# Altium schematic sheet 1_Power.schdoc
size 297 x 209 mm; Symbol: Drawing-Symbol_A4; Device: Drawing-Symbol_A4; @Project Name: Irrigation Controller v2; @Page Count: 5; @Update Date: 2026-11-21; @Create Date: 2026-11-21; @Schematic Name: Schematic1; @Page No: 1; @Page Name: 1_Power; Company: EasyEDA.com; Version: V1.0; Page Size: A4; @Create Time: 17:26:39; @Update Time: 17:26:39; Border: 1; Width: 1170; Height: 825; Region Start: 1; X Region Count: 6; Y Region Count: 4; Blade Width: 10; Title Block Position: 3; @Board Name: Board1
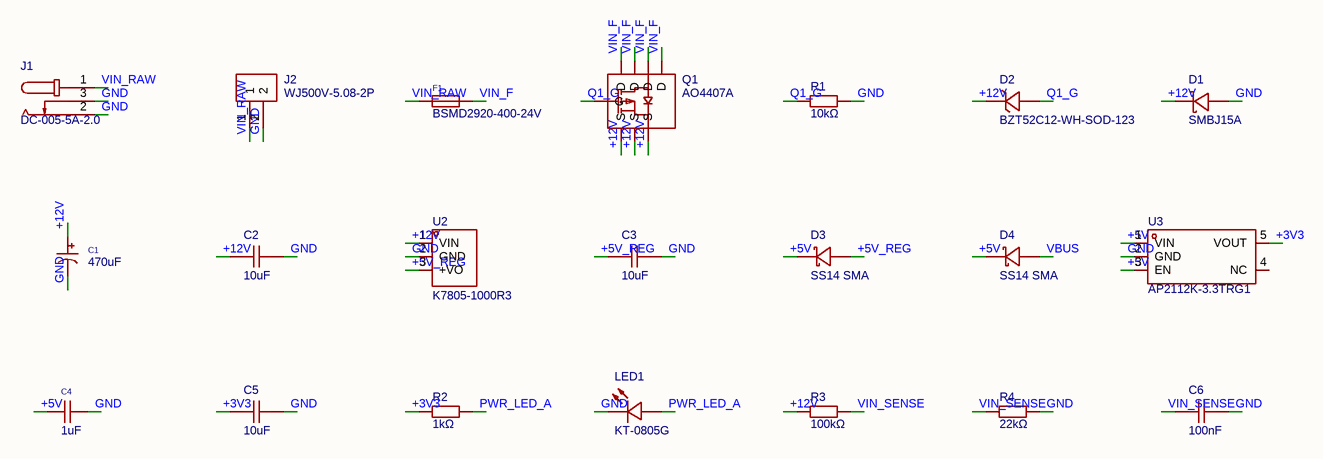
[diagram p0: 1_Power.schdoc]

## Parts
C1  470uF  [CAP-SMD_BD10.0-L10.3-W10.3-LS11.0-FD]
C2  10uF  [C0805]
C3  10uF  [C0805]
C4  1uF  [C0805]
C5  10uF  [C0805]
C6  100nF  [C0805]
D1  SMBJ15A  [SMB_L4.6-W3.6-LS5.3-RD]
D2  BZT52C12-WH-SOD-123  [SOD-123_L2.7-W1.7-LS3.8-RD]
D3  SS14 SMA  [SMA_L4.3-W2.6-LS5.1-RD]
D4  SS14 SMA  [SMA_L4.3-W2.6-LS5.1-RD]
F1  BSMD2920-400-24V  [F2920]
J1  DC-005-5A-2.0  [DC-IN-TH_DC-005-5A-2.0]
J2  WJ500V-5.08-2P  [CONN-TH_2P-P5.00_WJ500V-5.08-2P]
LED1  KT-0805G  [LED0805-R-RD]
Q1  AO4407A  [SOIC-8_L4.9-W3.9-P1.27-LS6.0-BL]
R1  10kΩ  [R0805]
R2  1kΩ  [R0805]
R3  100kΩ  [R0805]
R4  22kΩ  [R0805]
U2  K7805-1000R3  [PWRM-TH_K78XX-2000]
U3  AP2112K-3.3TRG1  [SOT-25-5_L2.9-W1.6-P0.95-LS2.8-BL]

## Nets
+3V3: C5.1 R2.1 U3.5(VOUT)
+5V: C4.1 D3.1(K) D4.1(K) U3.1(VIN) U3.3(EN)
+5V_REG: C3.1 D3.2(A) U2.3(+VO)
+12V: C1.1 C2.1 D1.1(K) D2.1(K) Q1.1(S) Q1.2(S) Q1.3(S) R3.1 U2.1(VIN)
GND: C1.2 C2.2 C3.2 C4.2 C5.2 C6.2 D1.2(A) J1.2 J1.3 J2.2 LED1.2(K) R1.2 R4.2 U2.2(GND) U3.2(GND)
PWR_LED_A: LED1.1(A) R2.2
Q1_G: D2.2(A) Q1.4(G) R1.1
VBUS: D4.2(A)
VIN_F: F1.2 Q1.5(D) Q1.6(D) Q1.7(D) Q1.8(D)
VIN_RAW: F1.1 J1.1 J2.1
VIN_SENSE: C6.1 R3.2 R4.1

Not connected (* = marked no-connect by the designer): U3 4(NC)

## Notes on the sheet
- Create at
- 2026-11-21
- Schematic
- Board
- Schematic1
- Board1
- Update at
- Page
- 1_Power
- Drawn
- Reviewed
- Irrigation Controller v2
- Version
- V1.0
- Size
- A4
- Page  1  Total  5
- EasyEDA.com

## Library data of the parts
C1 = RVT1E471M1010: Capacitance:470uF Tolerance:±20% Tolerance:±20% Voltage Rating:25V Ripple Current:- Equivalent Series Resistance(ESR):- Diameter:10mm Height - Seated (Max):10.2mm Lifetime:2000hrs@105℃ Operating Temperature:-55℃~+105℃ Operating Temperature:-55℃~+105℃ Pola; Manufacturer: HONOR(荣誉); Symbol: RVT1E471M1010-C3351; Add into BOM: yes; PCB Layer: Default; Tolerance: ±20%; Voltage Rating: 25V; Polarity type: Polarized; ModelId: 44cb92e87a73435bbda93569417358d9|0819f05c4eef4c71ace90d822a990e87; ModelName: CAP-SMD_BD10.0-L10.3-W10.3-H10.2; ModelTransform: 405.511,456.692,0,90,0,0,-0.004,-0.001,0; Device: RVT1E471M1010; Convert to PCB: yes; Manufacturer Part: RVT1E471M1010; Supplier: LCSC; Supplier Part: C3351; Value: 470uF; JLCPCB Part Class: Extended Part; LCSC Part Name: 470uF ±20% 25V; Supplier Footprint: SMD,D10xL10.2mm; Datasheet: https://item.szlcsc.com/datasheet/RVT1E471M1010/3742.html; Ripple Current: -; Equivalent Series Resistance(ESR): -; Diameter: 10mm; Height - Seated (Max): 10.2mm; Lifetime: 2000hrs@105℃; Operating Temperature: -55℃~+105℃; FootprintName: CAP-SMD_BD10.0-L10.3-W10.3-LS11.0-FD
C2 C3 C5 = CL21A106KAYNNNE_C15850: Capacitance:10uF Tolerance:±10% Tolerance:±10% Voltage Rating:25V Temperature Coefficient:X5R; Manufacturer: SAMSUNG(三星); Add into BOM: yes; PCB Layer: Default; Tolerance: ±10%; Voltage Rating: 25V; Temperature Coefficient: X5R; ModelId: 8c88e81f49c6409b980720ec8953afb6|0819f05c4eef4c71ace90d822a990e87; ModelName: C0805_L2.0-W1.3-H1.3; ModelTransform: 78.74,51.181,0,0,0,0,0,0.0005,0; Symbol: CL21A106KAYNNNE; Device: CL21A106KAYNNNE_C15850; Convert to PCB: yes; Manufacturer Part: CL21A106KAYNNNE; Supplier: LCSC; Supplier Part: C15850; LCSC Part Name: 10uF ±10% 25V; Supplier Footprint: 0805; JLCPCB Part Class: Basic Part; Datasheet: https://item.szlcsc.com/datasheet/CL21A106KAYNNNE/16532.html; Value: 10uF; FootprintName: C0805
C4 = CL21B105KBFNNNE: Capacitance:1uF Tolerance:±10% Tolerance:±10% Voltage Rating:50V Temperature Coefficient:X7R; Manufacturer: SAMSUNG(三星); Add into BOM: yes; PCB Layer: Default; Tolerance: ±10%; Voltage Rating: 50V; Temperature Coefficient: X7R; ModelId: 8c88e81f49c6409b980720ec8953afb6|0819f05c4eef4c71ace90d822a990e87; ModelName: C0805_L2.0-W1.3-H1.3; ModelTransform: 78.74,51.181,0,0,0,0,0,0.0005,0; Symbol: CL21B105KBFNNNE; Device: CL21B105KBFNNNE; Convert to PCB: yes; Manufacturer Part: CL21B105KBFNNNE; Supplier: LCSC; Supplier Part: C28323; Value: 1uF; JLCPCB Part Class: Basic Part; LCSC Part Name: 1uF ±10% 50V; Supplier Footprint: 0805; Datasheet: https://item.szlcsc.com/datasheet/CL21B105KBFNNNE/29074.html; FootprintName: C0805
C6 = CC0805KRX7R9BB104: Capacitance:100nF Tolerance:±10% Tolerance:±10% Voltage Rating:50V Temperature Coefficient:X7R; Manufacturer: YAGEO(国巨); Add into BOM: yes; PCB Layer: Default; Tolerance: ±10%; Voltage Rating: 50V; Temperature Coefficient: X7R; ModelId: 8c88e81f49c6409b980720ec8953afb6|0819f05c4eef4c71ace90d822a990e87; ModelName: C0805_L2.0-W1.3-H1.3; ModelTransform: 78.74,51.181,0,0,0,0,0,0.0005,0; Symbol: CC0805KRX7R9BB104; Device: CC0805KRX7R9BB104; Convert to PCB: yes; Manufacturer Part: CC0805KRX7R9BB104; Supplier: LCSC; Supplier Part: C49678; LCSC Part Name: 100nF ±10% 50V; Supplier Footprint: 0805; JLCPCB Part Class: Basic Part; Datasheet: https://item.szlcsc.com/datasheet/CC0805KRX7R9BB104/50686.html; Value: 100nF; FootprintName: C0805
D1 = SMBJ15A: Reverse Stand-Off Voltage (Vrwm):15V Maximum Clamping Voltage:24.4V Peak Pulse Current (Ipp)@10/1000us:24.6A Breakdown Voltage:16.7V; Symbol: SMBJ15A_C232769; Add into BOM: yes; PCB Layer: Default; Reverse Stand-Off Voltage (Vrwm): 15V; Maximum Clamping Voltage: 24.4V; Peak Pulse Current (Ipp)@10/1000us: 24.6A; Breakdown Voltage: 16.7V; ModelId: 6383b9be09eb4825906cf4ce91b85cee|0819f05c4eef4c71ace90d822a990e87; ModelTransform: 212.598,141.732,0,0,0,0,0,0,0; Device: SMBJ15A; Convert to PCB: yes; Manufacturer Part: SMBJ15A; Supplier: LCSC; Supplier Part: C232769; LCSC Part Name: SMBJ15A; Supplier Footprint: SMB(DO-214AA); JLCPCB Part Class: Extended Part; FootprintName: SMB_L4.6-W3.6-LS5.3-RD; ModelName: SMB_L4.6-W3.6-LS5.3-RD
D2 = BZT52C12-WH-SOD-123: Diode Configuration:1 Independent Zener Voltage(Nom):12V Reverse Leakage Current (Ir):100nA@9V Zener Voltage(Range):11.4V~12.7V Zener Voltage(Range):11.4V~12.7V Pd - Power Dissipation:500mW Impedance(Zzt):35Ω Impedance(Zzk):600Ω Operating Junction Tempera; Manufacturer: SY(顺烨); Add into BOM: yes; PCB Layer: Default; Zener Voltage(Nom): 12V; Pd - Power Dissipation: 500mW; Impedance(Zzt): 35Ω; Impedance(Zzk): 600Ω; Operating Junction Temperature Range: -55℃~+150℃; ModelId: 619603fa8f4b456cbd6047d9f8e47121|0819f05c4eef4c71ace90d822a990e87; ModelTransform: 145.669,64.961,0,0,0,0,0,0,0; Symbol: BZT52C12-WH-SOD-123; Device: BZT52C12-WH-SOD-123; Convert to PCB: yes; Manufacturer Part: BZT52C12-WH-SOD-123; Supplier: LCSC; Supplier Part: C5464725; LCSC Part Name: 独立式 耐压:12V 电流:0.1uA@9V; Supplier Footprint: SOD-123; JLCPCB Part Class: Extended Part; Datasheet: https://item.szlcsc.com/datasheet/BZT52C12-WH-SOD-123/6380071.html; Diode Configuration: 1 Independent; Reverse Leakage Current (Ir): 100nA@9V; Zener Voltage(Range): 11.4V~12.7V; Tolerance: -; FootprintName: SOD-123_L2.7-W1.7-LS3.8-RD; ModelName: SOD-123_L2.7-W1.7-LS3.8-RD
D3 D4 = SS14 SMA: Diode Configuration:1 Independent Voltage - Forward(Vf@If):550mV@1A Voltage - DC Reverse(Vr):40V Current - Rectified:1A Reverse Leakage Current (Ir):500uA@40V Operating Junction Temperature Range:-65℃~+125℃ Operating Junction Temperature Range:-65℃~+125℃; Manufacturer: Yint(音特电子); Add into BOM: yes; PCB Layer: Default; Voltage - DC Reverse(Vr): 40V; Current - Rectified: 1A; Non-Repetitive Peak Forward Surge Current: 40A; ModelId: 9f0f28a3f5e244ceb50a0213b7a9858d|0819f05c4eef4c71ace90d822a990e87; ModelTransform: 196.4563,102.362,0,0,0,0,0.001,-0.001,0; Symbol: SS14 SMA; Device: SS14 SMA; Convert to PCB: yes; Manufacturer Part: SS14 SMA; Supplier: LCSC; Supplier Part: C2920036; LCSC Part Name: 电压:40V 电流:1A; Supplier Footprint: SMA(DO-214AC); JLCPCB Part Class: Extended Part; Datasheet: https://item.szlcsc.com/datasheet/SS14%2520SMA/3223905.html; Diode Configuration: 1 Independent; Voltage - Forward(Vf@If): 550mV@1A; Reverse Leakage Current (Ir): 500uA@40V; Operating Junction Temperature Range: -65℃~+125℃; FootprintName: SMA_L4.3-W2.6-LS5.1-RD; ModelName: SMA_L4.3-W2.6-LS5.1-RD
F1 = BSMD2920-400-24V: Voltage - Max:24V Current - Max:40A Hold Current:4A Trip Current:8A Power Dissipation:2W Resistance - Initial (Ri) (Min):8mΩ Resistance - Post Trip (R1) (Max):40mΩ Time to Trip(Max):4s Operating Temperature:-40℃~+85℃ Operating Temperature:-40℃~+85℃ Length; Manufacturer: BHFUSE(佰宏); Add into BOM: yes; PCB Layer: Default; Voltage - Max: 24V; Current - Max: 40A; Hold Current: 4A; Trip Current: 8A; Power Dissipation: 2W; Resistance - Initial (Ri) (Min): 8mΩ; Resistance - Post Trip (R1) (Max): 40mΩ; Time to Trip(Max): 4s; ModelId: c20979b6eed84fe694c25fdbe1326c05|0819f05c4eef4c71ace90d822a990e87; ModelName: F2920-1; ModelTransform: 289.7632,201.5744,0,0,0,0,0,0,0; Symbol: BSMD2920-400-24V; Device: BSMD2920-400-24V; Convert to PCB: yes; Manufacturer Part: BSMD2920-400-24V; Supplier: LCSC; Supplier Part: C960036; JLCPCB Part Class: Extended Part; LCSC Part Name: 24V 4A 2920自恢复; Supplier Footprint: 2920; Datasheet: https://item.szlcsc.com/datasheet/BSMD2920-400-24V/1039136.html; Operating Temperature: -40℃~+85℃; Length: 7.98mm; Width: 5.44mm; Height: 1.6mm; Pitch: -; FootprintName: F2920
J1 = DC-005-5A-2.0: Connector Type:DC Power Jack Mounting Type:Right Angle Inside Contact Diameter:2mm Outside Contact Diameter:6.2mm Current Rating:5A Voltage Rating (Max):24V Body Height:11mm Length:14mm Width:9mm Operating Temperature:-20℃~+70℃ Operating Temperature:-20℃~; Manufacturer: XKB Connection(中国星坤); Add into BOM: yes; PCB Layer: Default; Inside Contact Diameter: 2mm; Outside Contact Diameter: 6.2mm; Current Rating: 5A; Voltage Rating (Max): 24V; Body Height: 11mm; ModelId: 141bb14832c5420aa468d11a1b22105a|0819f05c4eef4c71ace90d822a990e87; ModelName: DC-IN-TH_L14.4-W9.0-H11.0; ModelTransform: 366.141,566.928,0,270,0,0,-143.701,86.614,-157.48; Symbol: DC-005-5A-2.0; Device: DC-005-5A-2.0; Convert to PCB: yes; Manufacturer Part: DC-005-5A-2.0; Supplier: LCSC; Supplier Part: C381116; LCSC Part Name: DC电源插座 内径:2mm 外径:6.2mm; Supplier Footprint: 插件; JLCPCB Part Class: Extended Part; Datasheet: https://item.szlcsc.com/datasheet/DC-005-5A-2.0/353348.html; Connector Type: DC Power Jack; Mounting Type: Right Angle; Length: 14mm; Width: 9mm; Operating Temperature: -20℃~+70℃; FootprintName: DC-IN-TH_DC-005-5A-2.0
J2 = WJ500V-5.08-2P: Number of Positions or Pins:1x2P Pitch:5.08mm Color:Green Mounting Type:Through Hole Number of Pins:2P Number of Rows:1 Number of PINs Per Row:2 Screw Specification:M2.5 Current Rating:18A Voltage Rating (Max):250V Wire Gauge - AWG:14~30 Wire Gauge - mm2:; Manufacturer: KANGNEX(康奈克斯电气); Symbol: WJ500V-5.08-2P-14-00A; Add into BOM: yes; PCB Layer: Default; Number of Positions or Pins: 1x2P; Pitch: 5.08mm; Number of PINs Per Row: 2; Screw Specification: M2.5; Current Rating: 18A; Voltage Rating (Max): 250V; Wire Gauge - AWG: 14~30; Wire Gauge - mm2: 2.5; ModelId: 2bff34d19d2f4f9cb7f6a8b7d3be06fd|0819f05c4eef4c71ace90d822a990e87; ModelTransform: 423.621,393.7,0,0,0,0,-11.811,19.685,-137.795; Device: WJ500V-5.08-2P; Convert to PCB: yes; Manufacturer Part: WJ500V-5.08-2P; Supplier: LCSC; Supplier Part: C8465; LCSC Part Name: 1x2P 5.08mm 直插 排数:1 每排P数:2; Supplier Footprint: 插件,P=5.08mm; JLCPCB Part Class: Extended Part; Datasheet: https://item.szlcsc.com/datasheet/WJ500V-5.08-2P/8959.html; Color: Green; Mounting Type: Through Hole; Number of Pins: 2P; Number of Rows: 1; Operating Temperature: -40℃~+105℃; Height Above Board: 14.07mm; FootprintName: CONN-TH_2P-P5.00_WJ500V-5.08-2P; ModelName: CONN-TH_2P-P5.00_WJ500V-5.08-2P
LED1 = KT-0805G: Lamp Holder Type:2mm x 1.25mm square LED Illumination Color:Emerald Green Voltage - Forward(Vf):2.6V~3.1V Voltage - Forward(Vf):2.6V~3.1V Power(Watts):100mW Forward Current:5mA Wavelength - Dominant:513nm~528nm Wavelength - Dominant:513nm~528nm Peak Wavel; Manufacturer: KENTO; Symbol: 0805G (Green); Add into BOM: yes; PCB Layer: Default; Power(Watts): 100mW; Forward Current: 5mA; Peak Wavelength: 525nm; Diode Configuration: Discrete Diode; Lens Color: Water Clear; Luminous Intensity: 430mcd; Viewing Angle: 120°; ModelId: 167045bb0eae412b9d5564860e113a91|0819f05c4eef4c71ace90d822a990e87; ModelName: LED0805-RD; ModelTransform: 79.527,49.2125,0,0,0,0,0,0,0; Device: KT-0805G; Convert to PCB: yes; Manufacturer Part: KT-0805G; Supplier: LCSC; Supplier Part: C2297; LCSC Part Name: 0805 翠绿 高亮; Supplier Footprint: 0805; JLCPCB Part Class: Basic Part; Datasheet: https://item.szlcsc.com/datasheet/KT-0805G/2670.html; Lamp Holder Type: 2mm x 1.25mm square LED; Illumination Color: Emerald Green; Voltage - Forward(Vf): 2.6V~3.1V; Wavelength - Dominant: 513nm~528nm; Color Temperature: -; Mounting Style: -; Operating Temperature: -40℃~+85℃; FootprintName: LED0805-R-RD
Q1 = AO4407A_C16072: Number:1 P-Channel Drain to Source Voltage:30V Current - Continuous Drain(Id):12A RDS(on):38mΩ@5V Pd - Power Dissipation:3.1W Gate Threshold Voltage (Vgs(th)):3V Gate Charge(Qg):39nC@10V Input Capacitance(Ciss):2.6nF Reverse Transfer Capacitance (Crss@Vds; Manufacturer: AOS; Add into BOM: yes; PCB Layer: Default; Drain to Source Voltage: 30V; Current - Continuous Drain(Id): 12A; Pd - Power Dissipation: 3.1W; Gate Threshold Voltage (Vgs(th)): 3V; Input Capacitance(Ciss): 2.6nF; Reverse Transfer Capacitance (Crss@Vds): 295pF; Output Capacitance(Coss): 370pF; Vgs: ±25V; ModelId: 2ec1ac1bf9bf4d09a988fcee15e6a02d|0819f05c4eef4c71ace90d822a990e87; ModelName: SOIC-8_L4.9-W3.9-H1.7-LS6.0-P1.27; ModelTransform: 192.913,236.22,0,0,0,0,0,0,0; Symbol: AO4407A; Device: AO4407A_C16072; Convert to PCB: yes; Manufacturer Part: AO4407A; Supplier: LCSC; Supplier Part: C16072; LCSC Part Name: 1个P沟道 耐压:30V 电流:12A; Supplier Footprint: SOIC-8; JLCPCB Part Class: Extended Part; Datasheet: https://item.szlcsc.com/datasheet/AO4407A/16754.html; Number: 1 P-Channel; RDS(on): 38mΩ@5V; Gate Charge(Qg): 39nC@10V; Operating Temperature: -; Configuration: -; Type: P-Channel; FootprintName: SOIC-8_L4.9-W3.9-P1.27-LS6.0-BL
R1 = 0805W8F1002T5E: Type:Thick Film Resistor Resistance:10kΩ Tolerance:±1% Tolerance:±1% Power(Watts):125mW Voltage-Supply(Max):150V Temperature Coefficient:±100ppm/℃ Temperature Coefficient:±100ppm/℃ Operating Temperature:-55℃~+155℃ Operating Temperature:-55℃~+155℃; Manufacturer: UNI-ROYAL(厚声); Add into BOM: yes; PCB Layer: Default; Tolerance: ±1%; Power(Watts): 125mW; Voltage-Supply(Max): 150V; ModelId: b83c7c5430874b8eb2319a65d9433429|0819f05c4eef4c71ace90d822a990e87; ModelName: R0805_L2.0-W1.3-H0.6; ModelTransform: 78.74,51.181,0,0,0,0,0,-0.0005,0; Symbol: 0805W8F1002T5E; Device: 0805W8F1002T5E; Convert to PCB: yes; Manufacturer Part: 0805W8F1002T5E; Supplier: LCSC; Supplier Part: C17414; LCSC Part Name: 厚膜电阻 10kΩ ±1%; Supplier Footprint: 0805; JLCPCB Part Class: Basic Part; Datasheet: https://item.szlcsc.com/datasheet/0805W8F1002T5E/18102.html; Type: Thick Film Resistor; Value: 10kΩ; Temperature Coefficient: ±100ppm/℃; Operating Temperature: -55℃~+155℃; FootprintName: R0805
R2 = 0805W8F1001T5E: Type:Thick Film Resistors Resistance:1kΩ Tolerance:±1% Tolerance:±1% Power(Watts): Overload Voltage (Max): Temperature Coefficient:±100ppm/℃ Temperature Coefficient:±100ppm/℃ Operating Temperature Range:-55℃~+155℃ Operating Temperature Range:-55℃~+155℃; Manufacturer: UNI-ROYAL(厚声); Add into BOM: yes; PCB Layer: Default; Tolerance: ±1%; ModelId: b83c7c5430874b8eb2319a65d9433429|0819f05c4eef4c71ace90d822a990e87; ModelName: R0805_L2.0-W1.3-H0.6; ModelTransform: 78.74,51.181,0,0,0,0,0,-0.0005,0; Symbol: 0805W8F1001T5E; Device: 0805W8F1001T5E; Convert to PCB: yes; Manufacturer Part: 0805W8F1001T5E; Supplier: LCSC; Supplier Part: C17513; LCSC Part Name: 1kΩ ±1% 125mW 厚膜电阻; Supplier Footprint: 0805; JLCPCB Part Class: Basic Part; Datasheet: https://atta.szlcsc.com/upload/public/pdf/source/20200306/C422600_1E6D84923E4A46A82E41ADD87F860B5C.pdf; Type: Thick Film Resistors; Value: 1kΩ; Temperature Coefficient: ±100ppm/℃; Operating Temperature Range: -55℃~+155℃; FootprintName: R0805
R3 = 0805W8F1003T5E (SMT业务专用): Type: Resistance: Tolerance:±1% Tolerance:±1% Power(Watts):- Overload Voltage (Max):-; Manufacturer: UNI-ROYAL(厚声); Add into BOM: yes; PCB Layer: Default; Tolerance: ±1%; ModelId: b83c7c5430874b8eb2319a65d9433429|0819f05c4eef4c71ace90d822a990e87; ModelName: R0805_L2.0-W1.3-H0.6; ModelTransform: 78.74,51.181,0,0,0,0,0,-0.0005,0; Symbol: 0805W8F1003T5E; Device: 0805W8F1003T5E (SMT业务专用); Convert to PCB: yes; Manufacturer Part: 0805W8F1003T5E (SMT业务专用); Supplier: LCSC; Supplier Part: C17407; LCSC Part Name: 100kΩ ±1%; Supplier Footprint: 0805; JLCPCB Part Class: Extended Part; Datasheet: https://atta.szlcsc.com/upload/public/pdf/source/20200102/C423413_58AC64FF5730584578C10BF0002471B1.pdf; Value: 100kΩ; Power(Watts): -; Overload Voltage (Max): -; FootprintName: R0805
R4 = 0805W8F2202T5E: Type:Thick Film Resistor Resistance:22kΩ Tolerance:±1% Tolerance:±1% Power(Watts):125mW Voltage-Supply(Max):150V Temperature Coefficient:±100ppm/℃ Temperature Coefficient:±100ppm/℃ Operating Temperature:-55℃~+155℃ Operating Temperature:-55℃~+155℃; Manufacturer: UNI-ROYAL(厚声); Add into BOM: yes; PCB Layer: Default; Tolerance: ±1%; Power(Watts): 125mW; Voltage-Supply(Max): 150V; ModelId: b83c7c5430874b8eb2319a65d9433429|0819f05c4eef4c71ace90d822a990e87; ModelName: R0805_L2.0-W1.3-H0.6; ModelTransform: 78.74,51.181,0,0,0,0,0,-0.0005,0; Symbol: 0805W8F2202T5E; Device: 0805W8F2202T5E; Convert to PCB: yes; Manufacturer Part: 0805W8F2202T5E; Supplier: LCSC; Supplier Part: C17560; LCSC Part Name: 厚膜电阻 22kΩ ±1%; Supplier Footprint: 0805; JLCPCB Part Class: Basic Part; Datasheet: https://item.szlcsc.com/datasheet/0805W8F2202T5E/18248.html; Type: Thick Film Resistor; Value: 22kΩ; Temperature Coefficient: ±100ppm/℃; Operating Temperature: -55℃~+155℃; FootprintName: R0805
U2 = K7805-1000R3_C111280: Type:- Function:- Number of Outputs:1 Voltage - Supply:8V~36V Voltage - Supply:8V~36V Conversion Efficiency:86%；93% Conversion Efficiency:86%；93% Output Voltage:-5V；5V Output Voltage:-5V；5V Output Voltage Accuracy:±3% Output Voltage Accuracy:±3% Output Cu; Manufacturer: MORNSUN(金升阳); Add into BOM: yes; PCB Layer: Default; Number of Outputs: 1; Voltage - Supply: 8V~36V; Output Voltage: -5V；5V; Output Voltage Accuracy: ±3%; Output Current(Max): 1A；-500mA; Quiescent Supply Current: 100uA; Ripple Noise: 75mVp-p; Switching Frequency: 520kHz; Capacitive Load(Max): 680uF；330uF; ModelId: 655201e880d449c5a288a7368650974c|0819f05c4eef4c71ace90d822a990e87; ModelName: PWRM-TH_L11.5-W9.0-H17.5-P2.54; ModelTransform: 452.755,354.33,0,0,0,0,0.512,-92.48,-137.795; Symbol: K7805-1000R3; Device: K7805-1000R3_C111280; Convert to PCB: yes; Manufacturer Part: K7805-1000R3; Supplier: LCSC; Supplier Part: C111280; LCSC Part Name: DC/DC模块电源，宽电压输入，非隔离稳压单路输出; Supplier Footprint: SIP,11.5x9mm; JLCPCB Part Class: Extended Part; Datasheet: https://item.szlcsc.com/datasheet/K7805-1000R3/112506.html; Type: -; Function: -; Conversion Efficiency: 86%；93%; Operating Temperature Range: -40℃~+85℃; Length: 11.5mm; Width: 9mm; Height: 17.5mm; Features: Short Circuit Protection；Automatic fault recovery; FootprintName: PWRM-TH_K78XX-2000
U3 = AP2112K-3.3TRG1: Output Configuration:Positive Voltage - Supply:6V Output Voltage:3.3V Output Voltage:3.3V Output Current:600mA Power Supply Rejection Ratio (PSRR):65dB@(1kHz) Voltage Dropout:250mV@(600mA) standby current:55uA Noise:50uVrms Features:Enable control；Short C; Manufacturer: DIODES(美台); Add into BOM: yes; PCB Layer: Default; Voltage - Supply: 6V; Output Voltage: 3.3V; standby current: 55uA; Output Type: Fixed; Number of Outputs: 1; ModelId: 6177bbcd6fc94df4b4ba2f22405723a0|0819f05c4eef4c71ace90d822a990e87; ModelTransform: 114.173,110.236,0,0,0,0,0,0,0; Symbol: AP2112K-3.3TRG1; Device: AP2112K-3.3TRG1; Convert to PCB: yes; Manufacturer Part: AP2112K-3.3TRG1; Supplier: LCSC; Supplier Part: C51118; LCSC Part Name: 3.3V 600mA 6V; Supplier Footprint: SOT-25-5; JLCPCB Part Class: Extended Part; Datasheet: https://item.szlcsc.com/datasheet/AP2112K-3.3TRG1/52131.html; Output Configuration: Positive; Output Current: 600mA; Power Supply Rejection Ratio (PSRR): 65dB@(1kHz); Voltage Dropout: 250mV@(600mA); Noise: 50uVrms; Features: Enable control；Short Circuit Protection；Output discharge；Over Current Protection；Thermal shutdown; Operating Temperature: -40℃~+85℃@(Ta); FootprintName: SOT-25-5_L2.9-W1.6-P0.95-LS2.8-BL; ModelName: SOT-25-5_L2.9-W1.6-P0.95-LS2.8-BL